# Altium schematic sheet IDC_Tester_v1_LED_6.SchDoc
size A4; SheetNumber: 8; SheetTotal: 9
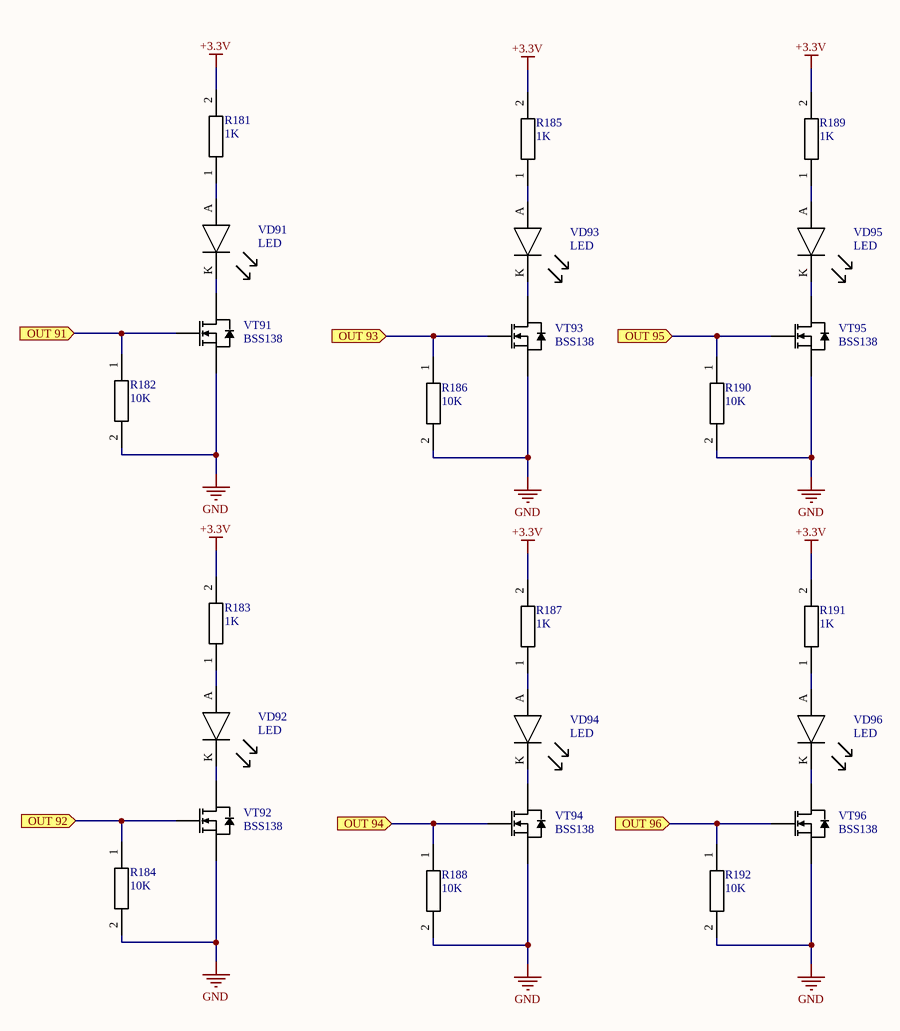
[diagram p0: IDC_Tester_v1_LED_6.SchDoc]

## Parts
R181  1K  [Resistor 0603]
R182  10K  [Resistor 0603]
R183  1K  [Resistor 0603]
R184  10K  [Resistor 0603]
R185  1K  [Resistor 0603]
R186  10K  [Resistor 0603]
R187  1K  [Resistor 0603]
R188  10K  [Resistor 0603]
R189  1K  [Resistor 0603]
R190  10K  [Resistor 0603]
R191  1K  [Resistor 0603]
R192  10K  [Resistor 0603]
VD91  LED  [Led 0603 - duplicate]
VD92  LED  [Led 0603 - duplicate]
VD93  LED  [Led 0603 - duplicate]
VD94  LED  [Led 0603 - duplicate]
VD95  LED  [Led 0603 - duplicate]
VD96  LED  [Led 0603 - duplicate]
VT91  BSS138  [SOT-23-3]
VT92  BSS138  [SOT-23-3]
VT93  BSS138  [SOT-23-3]
VT94  BSS138  [SOT-23-3]
VT95  BSS138  [SOT-23-3]
VT96  BSS138  [SOT-23-3]

## Ports
OUT 91 (in), OUT 92 (in), OUT 93 (in), OUT 94 (in), OUT 95 (in), OUT 96 (in)

## Nets
+3.3V: R181.2 R183.2 R185.2 R187.2 R189.2 R191.2
GND: R182.2 R184.2 R186.2 R188.2 R190.2 R192.2 VT91.2(S) VT92.2(S) VT93.2(S) VT94.2(S) VT95.2(S) VT96.2(S)
OUT 91: R182.1 VT91.1(G) ; port OUT 91
OUT 92: R184.1 VT92.1(G) ; port OUT 92
OUT 93: R186.1 VT93.1(G) ; port OUT 93
OUT 94: R188.1 VT94.1(G) ; port OUT 94
OUT 95: R190.1 VT95.1(G) ; port OUT 95
OUT 96: R192.1 VT96.1(G) ; port OUT 96
NetR181_1: R181.1 VD91.A
NetR183_1: R183.1 VD92.A
NetR185_1: R185.1 VD93.A
NetR187_1: R187.1 VD94.A
NetR189_1: R189.1 VD95.A
NetR191_1: R191.1 VD96.A
NetVD91_K: VD91.K VT91.3(D)
NetVD92_K: VD92.K VT92.3(D)
NetVD93_K: VD93.K VT93.3(D)
NetVD94_K: VD94.K VT94.3(D)
NetVD95_K: VD95.K VT95.3(D)
NetVD96_K: VD96.K VT96.3(D)

## Library data of the parts
R181 R183 R185 R187 R189 R191 = Resistor 1K: Part Number: SMD RES 1K OHM 1%±100ppm/°C 0603 (RMCF0603FT1K00); Added by: viskov2055@gmail.com; Mount_Type: SMD; Solder_Amount: 2; Pkg: 0603; Created at: 13/02/2024; Mount: MOUNT
R182 R184 R186 R188 R190 R192 = Resistor 10K: Part Number: SMD RES 10K OHM 1%±100ppm/°C 0603 (RMCF0603FT10K0); Added by: viskov2055@gmail.com; Mount_Type: SMD; Solder_Amount: 2; Pkg: 0603; Created at: 15/02/2024; Mount: MOUNT
VD91-VD96 = LED: LED Uni-Color Green 515nm 2-Pin SMD T/R; Manufacturer: Kingbright; Manufacturer Part Number: APG1608ZGCK; Lens Style: Flat; Lens Transparency: Clear; Luminous Intensity: 400mcd; Forward Voltage: 3.3V; Test Current: 20mA; Viewing Angle: 130°; Dominant Wavelength: 525nm; Lens Size: 0.8mm; Added by: viskov2055@gmail.com; Solder_Amount: 2; Pkg: 0603; RoHS: Yes; Category: LEDs; Stock 1: 44996; Pricing 1: 1=0,6, 10=0,368, 100=0,2114, 1000=0,16544, 2000=0,15165 (USD); MountType: SMD; Case/Package: 0603; Color: Green; Case Code (Imperial): 0603; Case Code (Metric): 1608; Packaging: Tape and Reel; Length: 1.6mm; Width: 0.8mm; Height: 0.28mm; RoHS Compliant: Yes; ComponentLink1URL: https://datasheet.octopart.com/APG1608ZGCK-Kingbright-datasheet-153682089.pdf?src-supplier=Future+Electronics; ComponentLink1Description: https://datasheet.octopart.com/APG1608ZGCK-Kingbright-datasheet-153682089.pdf?src-supplier=Future+Electronics; ComponentLink2URL: http://www.kingbrightusa.com/images/catalog/SPEC/APG1608ZGCK.pdf?src-supplier=Digikey; ComponentLink2Description: http://www.kingbrightusa.com/images/catalog/SPEC/APG1608ZGCK.pdf?src-supplier=Digikey; ComponentLink3URL: https://datasheet.octopart.com/APG1608ZGCK-Kingbright-datasheet-137408059.pdf?src-supplier=Sager+Electronics; ComponentLink3Description: https://datasheet.octopart.com/APG1608ZGCK-Kingbright-datasheet-137408059.pdf?src-supplier=Sager+Electronics; Supplier Part Number 1: 754-2113-1-ND; Created at: 13/02/2024; Mount: MOUNT; Part Number: APG1608ZGCK; Supplier 1: Digikey
VT91-VT96 = BSS138: N-Channel Logic Level Enhancement Mode Field Effect Transistor; Solder_Amount: 3; Added_by: ma_lubushkin@teslatec.ru; Pkg: SOT-23; Part Number: BSS138; Mount: MOUNT; MountType: SMD; Created_at: 03/12/2019